# Altium schematic sheet VDUT.SchDoc
size Letter; SheetNumber: 6; SheetTotal: 15
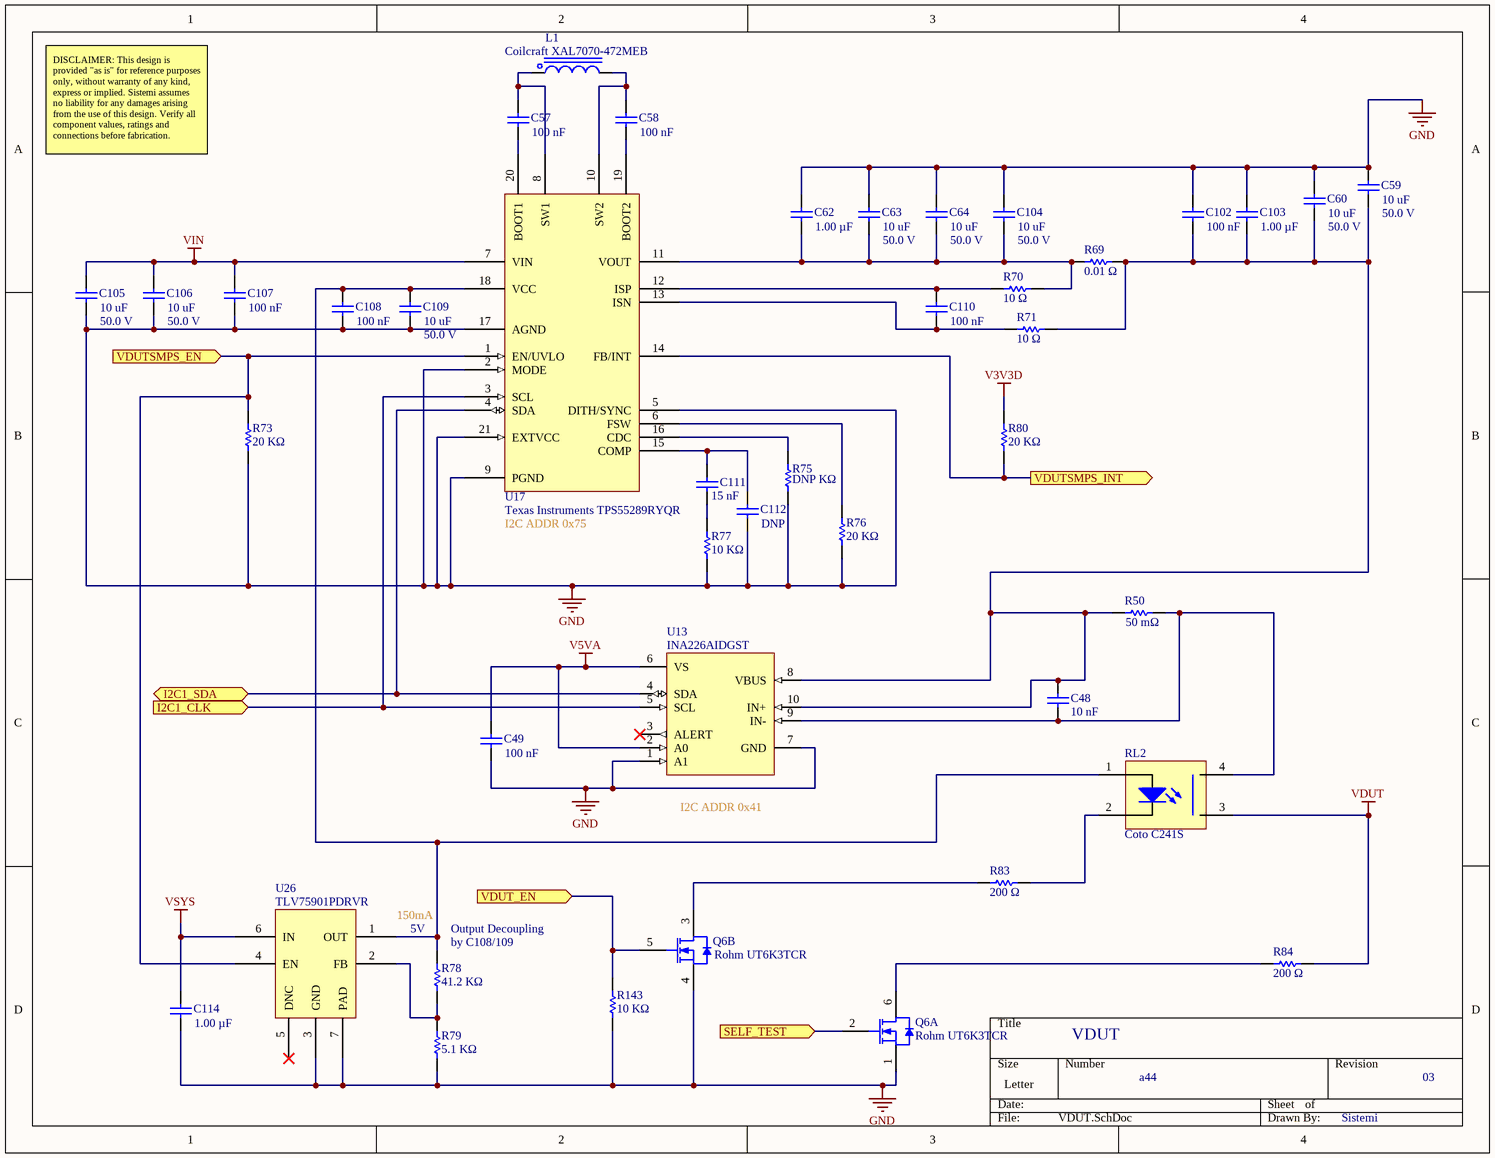
[diagram p0: VDUT.SchDoc]

## Parts
C48  Capacitance: 10 nF  [CAPC1005X56X25NL10T15]  (hidden comment: 10 nF,±10%,25V,CGO,0402)
C49  Capacitance: 100 nF  [CAPC1005X56X25NL10T15]  (hidden comment: Samsung CL05B104KO5NNNC)
C57  Capacitance: 100 nF  [CAPC1005X56X25NL10T15]  (hidden comment: Samsung CL05B104KO5NNNC)
C58  Capacitance: 100 nF  [CAPC1005X56X25NL10T15]  (hidden comment: Samsung CL05B104KO5NNNC)
C59  Capacitance: 10 uF  Voltage Rating (DC): 50.0 V  [CAPC3216X180X55LL20T25]  (hidden comment: Murata GRM31CR61H106KA12L)
C60  Capacitance: 10 uF  Voltage Rating (DC): 50.0 V  [CAPC3216X180X55LL20T25]  (hidden comment: Murata GRM31CR61H106KA12L)
C62  Capacitance: 1.00 µF  [CAPC1608X90X35NL15T15]  (hidden comment: Samsung CL10B105KA8NNNC)
C63  Capacitance: 10 uF  Voltage Rating (DC): 50.0 V  [CAPC3216X180X55LL20T25]  (hidden comment: Murata GRM31CR61H106KA12L)
C64  Capacitance: 10 uF  Voltage Rating (DC): 50.0 V  [CAPC3216X180X55LL20T25]  (hidden comment: Murata GRM31CR61H106KA12L)
C102  Capacitance: 100 nF  [CAPC1005X56X25NL10T15]  (hidden comment: Samsung CL05B104KO5NNNC)
C103  Capacitance: 1.00 µF  [CAPC1608X90X35NL15T15]  (hidden comment: Samsung CL10B105KA8NNNC)
C104  Capacitance: 10 uF  Voltage Rating (DC): 50.0 V  [CAPC3216X180X55LL20T25]  (hidden comment: Murata GRM31CR61H106KA12L)
C105  Capacitance: 10 uF  Voltage Rating (DC): 50.0 V  [CAPC3216X180X55LL20T25]  (hidden comment: Murata GRM31CR61H106KA12L)
C106  Capacitance: 10 uF  Voltage Rating (DC): 50.0 V  [CAPC3216X180X55LL20T25]  (hidden comment: Murata GRM31CR61H106KA12L)
C107  Capacitance: 100 nF  [CAPC1005X56X25NL10T15]  (hidden comment: Samsung CL05B104KO5NNNC)
C108  Capacitance: 100 nF  [CAPC1005X56X25NL10T15]  (hidden comment: Samsung CL05B104KO5NNNC)
C109  Capacitance: 10 uF  Voltage Rating (DC): 50.0 V  [CAPC3216X180X55LL20T25]  (hidden comment: Murata GRM31CR61H106KA12L)
C110  Capacitance: 100 nF  [CAPC1005X56X25NL10T15]  (hidden comment: Samsung CL05B104KO5NNNC)
C111  Capacitance: 15 nF  [CAPC1005X56X25NL10T15]  (hidden comment: 15 nF,±10%,25V,CGO,0402)
C112  Capacitance: DNP  [CAPC1005X56X25NL10T15]  (hidden comment: DNP,±10%,25V,CGO,0402)
C114  Capacitance: 1.00 µF  [CAPC1608X90X35NL15T15]  (hidden comment: Samsung CL10B105KA8NNNC)
L1  Coilcraft XAL7070-472MEB  [PCB-mw0ri1kelkujqd8k45jk-1]
Q6  Rohm UT6K3TCR  [DFN2020-8D]  (parts A,B of 2)
R50  Resistance: 50 mΩ  [RESC1608X55X30ML15T15]  (hidden comment: Generic RES 0603)
R69  Resistance: 0.01 Ω  [RESC1005X40X25NL05T05]  (hidden comment: 0.01 Ω,±1%,0402)
R70  Resistance: 10 Ω  [RESC1005X40X25NL05T05]  (hidden comment: 10 Ω,±1%,0402)
R71  Resistance: 10 Ω  [RESC1005X40X25NL05T05]  (hidden comment: 10 Ω,±1%,0402)
R73  Resistance: 20 KΩ  [RESC1608X55X30ML15T15]  (hidden comment: Generic RES 0603)
R75  Resistance: DNP KΩ  [RESC1005X40X25NL05T05]  (hidden comment: DNP KΩ,±1%,0402)
R76  Resistance: 20 KΩ  [RESC1608X55X30ML15T15]  (hidden comment: Generic RES 0603)
R77  Resistance: 10 KΩ  [RESC1608X55X30ML15T15]  (hidden comment: Generic RES 0603)
R78  Resistance: 41.2 KΩ  [RESC1608X55X30LL15T15]  (hidden comment: Generic RES 0603)
R79  Resistance: 5.1 KΩ  [RESC1608X55X30LL15T15]  (hidden comment: Generic RES 0603)
R80  Resistance: 20 KΩ  [RESC1608X55X30ML15T15]  (hidden comment: Generic RES 0603)
R83  Resistance: 200 Ω  [RESC1608X55X30LL15T15]  (hidden comment: Generic RES 0603)
R84  Resistance: 200 Ω  [RESC1608X55X30LL15T15]  (hidden comment: Generic RES 0603)
R143  Resistance: 10 KΩ  [RESC1608X55X30LL15T15]  (hidden comment: Generic RES 0603)
RL2  Coto C241S  [PCB-o1m8470la7x8r6xoffbd-1]
U13  INA226AIDGST  [TSSOP10]
U17  Texas Instruments TPS55289RYQR  [DSG8-1600X900TP]
U26  TLV75901PDRVR  [PCB-ude52gq66msu1251nhm5-1]

## Ports
I2C1_CLK (in), I2C1_SDA (bidir), SELF_TEST (in), VDUT_EN (in), VDUTSMPS_EN (in), VDUTSMPS_INT (out)

## Nets
3: Q6.8(D)
6: Q6.7(D)
GND: C49.1 C59.2 C60.2 C62.2 C63.2 C64.2 C102.2 C103.2 C104.2 C105.1 C106.1 C107.1 C108.1 C109.1 C112.1 C114.1 Q6.1(S) Q6.4(S) R73.1 R75.1 R76.1 R77.2 R79.1 R143.1 U13.1(A1) U13.7(GND) U17.2(MODE) U17.5(DITH/SYNC) U17.9(PGND) U17.17(AGND) U17.21(EXTVCC) U26.3(GND) U26.7(PAD)
V3V3D: R80.2
V5VA: C49.2 U13.2(A0) U13.6(VS)
VDUT: R84.1 RL2.3(S)
VIN: C105.2 C106.2 C107.2 U17.7(VIN)
VSYS: C114.2 U26.6(IN)
I2C1_CLK: U13.5(SCL) U17.3(SCL) ; port I2C1_CLK
I2C1_SDA: U13.4(SDA) U17.4(SDA) ; port I2C1_SDA
SELF_TEST: Q6.2(G) ; port SELF_TEST
VDUT_EN: Q6.5(G) R143.2 ; port VDUT_EN
VDUTSMPS_EN: R73.2 U17.1(EN/UVLO) U26.4(EN) ; port VDUTSMPS_EN
VDUTSMPS_INT: R80.1 U17.14(FB/INT) ; port VDUTSMPS_INT
NetC48_1: C48.1 R50.2 RL2.4(D) U13.9(IN-)
NetC48_2: C48.2 C59.1 C60.1 C102.1 C103.1 R50.1 R69.1 R71.1 U13.8(VBUS) U13.10(IN+)
NetC57_1: C57.1 U17.20(BOOT1)
NetC57_2: C57.2 L1.2 U17.8(SW1)
NetC58_1: C58.1 U17.19(BOOT2)
NetC58_2: C58.2 L1.1 U17.10(SW2)
NetC62_1: C62.1 C63.1 C64.1 C104.1 R69.2 R70.1 U17.11(VOUT)
NetC108_2: C108.2 C109.2 R78.2 RL2.1(A) U17.18(VCC) U26.1(OUT)
NetC110_1: C110.1 R71.2 U17.13(ISN)
NetC110_2: C110.2 R70.2 U17.12(ISP)
NetC111_1: C111.1 R77.1
NetC111_2: C111.2 C112.2 U17.15(COMP)
NetQ6_3: Q6.3(D) R83.2
NetQ6_6: Q6.6(D) R84.2
NetR75_2: R75.2 U17.16(CDC)
NetR76_2: R76.2 U17.6(FSW)
NetR78_1: R78.1 R79.2 U26.2(FB)
NetR83_1: R83.1 RL2.2(K)

Not connected (* = marked no-connect by the designer): U13 3(ALERT)*; U26 5(DNC)*

## Notes on the sheet
- DISCLAIMER: This design is provided "as is" for reference purposes only, without warranty of any kind, express or implied. Sistemi assumes no liability for any damages arising from the use of this design. Verify all component values, ratings and connections before fabrication.
- (near U17) I2C ADDR 0x75
- (near U13) I2C ADDR 0x41
- 150mA
- (near R78) 5V
- (near R78) Output Decoupling
- (near R78) by C108/109
- VDUT
- a44
- 03
- Sistemi

## Library data of the parts
C48 = CMP-bf2276a55d9a60e5-20: Generic CAP 0402, =Capacitance+','+Tolerance+','+Voltage+','+Dielectric+','+Case; Manufacturer Part Number: GRM1555C1E103JE01J; Lead-Free Status: Lead Free; Octopart URL: TBD; Case: 0402; OctopartID: 0755ced2c795d892; Voltage: 25V; Dielectric: CGO; RoHS: Compliant; Mounting Style: Surface Mount; Tolerance: ±10%; Footprint: PCB-0002-00476-3
C49 C57 C58 C102 C107 C108 C110 = CMP-bf2276a55d9a60e5-19: Ceramic capacitor SMD-0402 100nF /16V X7R# K +-10%, Samsung, RoHS; Dielectric Characteristic: X7R; Lead-Free Status: Lead Free; Voltage Rating (DC): 16.0 V; Capacitance Tolerance: ±10%; Mounting Style: Surface Mount; Case/Package: 0402; OctopartID: 0755ced2c795d892; Footprint: PCB-0002-00476-3; Octopart URL: https://octopart.com/cl05b104ko5nnnc-samsung-9299366; RoHS: Compliant; Manufacturer Part Number: CL05B104KO5NNNC
C59 C60 C63 C64 C104-C106 C109 = CMP-3554908-2: Multilayer Ceramic Capacitors MLCC - SMD/SMT 1206 10uF 50volt X5R +/-10%; Manufacturer Part Number: CL31B106KBHNNNE; Capacitance Tolerance: ±10%; Case/Package (SI): 3216; Lead-Free Status: Lead Free; Dielectric Characteristic: X5R; Lifecycle Status: Active; Mounting Style: Surface Mount; Number of Pins: 2; Octopart Url: https://octopart.com/grm31cr61h106ka12l-murata-18903335; OctopartID: fd8535afa9c42242; Packaging: Cut Tape (CT); REACH SVHC Compliance: No SVHC; RoHS: Compliant; Size-Length: 0.0032 m; Size-Thickness: 0.0016 m; Size-Width: 0.0016 m
C62 C103 C114 = CMP-7473528-5: CL Series 0603 1 uF 25 V ±10 % X7R Surface Mount Multilayer Ceramic Capacitor; Manufacturer Part Number: UMK107AB7105KA-T; Lead-Free Status: Lead Free; Capacitance Tolerance: ±10%; Voltage Rating (DC): 25.0 V; RoHS: Compliant; Mounting Style: Surface Mount; Footprint: PCB-0002-00062-3; Octopart URL: http://octopart.com/cl10b105ka8nnnc-samsung-19831597; Case/Package: 0603; OctopartID: ce7a065e703111bd; Dielectric Characteristic: X7R
C111 = CMP-bf2276a55d9a60e5-20: Generic CAP 0402, =Capacitance+','+Tolerance+','+Voltage+','+Dielectric+','+Case; Manufacturer Part Number: CGA2B3X7R1H153K050BB; Lead-Free Status: Lead Free; Octopart URL: TBD; Case: 0402; OctopartID: 0755ced2c795d892; Voltage: 25V; Dielectric: CGO; RoHS: Compliant; Mounting Style: Surface Mount; Tolerance: ±10%; Footprint: PCB-0002-00476-3
C112 = CMP-bf2276a55d9a60e5-20: Generic CAP 0402, =Capacitance+','+Tolerance+','+Voltage+','+Dielectric+','+Case; Manufacturer Part Number: TBD; Lead-Free Status: Lead Free; Octopart URL: TBD; Case: 0402; OctopartID: 0755ced2c795d892; Voltage: 25V; Dielectric: CGO; RoHS: Compliant; Mounting Style: Surface Mount; Tolerance: ±10%; Footprint: PCB-0002-00476-3
L1 = CMP-70ddb8c9bb54af1a-1: Power inductor, shielded, 20% tol, SMT, RoHS, halogen f; Lead-Free Status: Contains Lead; Manufacturer Part Number: XAL7070-472MEB; Mounting Style: Surface Mount; Lifecycle Status: Active; Octopart Url: https://octopart.com/xal7070-472meb-coilcraft-18804463; RoHS: Compliant; OctopartID: 70ddb8c9bb54af1a; Packaging: Reel
Q6 = CMP-7da2b0d499b7a265-2: On a Reel of 3000, Dual N-Channel MOSFET, 5.5 A, 30 V, 8-Pin DFN ROHM UT6K3TCR; Polarity: Dual N-Channel; Footprint: PCB-qj1nrqbgj5udp5r3frdj-1; RoHS: Compliant; OctopartID: 7da2b0d499b7a265; Manufacturer Part Number: UT6K3TCR; Operating Temperature: 150 °C (max); Octopart URL: https://octopart.com/ut6k3tcr-rohm-75284851
R50 = CMP-0800c38b3cf2d7c7-3: Generic RES 0603, =Resistance+','+Tolerance+','+Case; Manufacturer Part Number: WSLP0603R0500FEB; Case/Package (SI): 1608; Lead-Free Status: Lead Free; Power Rating: 63.0 mW; Voltage: 50V; ELV Compliant: Compliant; Tolerance: ±1%; Temperature Coefficient: -50.0 ppm/°C to 50.0 ppm/°C; Octopart URL: TBD; Number of Pins: 2; Mounting Style: Surface Mount; Packaging: Tape & Reel (TR); Lifecycle Status: Active; RoHS: Compliant; Case: 0603; Operating Temperature: -55.0 °C to 125 °C; REACH SVHC Compliance: No SVHC; Footprint: PCB-0002-00066-3; OctopartID: a8e96364fc37772e
R69 = CMP-3902036-3: Generic RES 0402, =Resistance+','+Tolerance+','+Case; Manufacturer Part Number: MFSA0402R0100FAM; Lead-Free Status: Lead Free; Voltage: 50.0 V; Power: 0.063 W; Mounting Style: Surface Mount; RoHS: Compliant; Number of Pins: 2; Tolerance: ±1%; Octopart Url: TBD; Case: 0402; OctopartID: 26dced8948c2f91b
R70 R71 = CMP-3902036-3: Generic RES 0402, =Resistance+','+Tolerance+','+Case; Manufacturer Part Number: RT0402FRE0710RL; Lead-Free Status: Lead Free; Voltage: 50.0 V; Power: 0.063 W; Mounting Style: Surface Mount; RoHS: Compliant; Number of Pins: 2; Tolerance: ±1%; Octopart Url: TBD; Case: 0402; OctopartID: 26dced8948c2f91b
R73 R76 R80 = CMP-0800c38b3cf2d7c7-3: Generic RES 0603, =Resistance+','+Tolerance+','+Case; Manufacturer Part Number: RT0603FRE1320KL; Case/Package (SI): 1608; Lead-Free Status: Lead Free; Power Rating: 63.0 mW; Voltage: 50V; ELV Compliant: Compliant; Tolerance: ±1%; Temperature Coefficient: -50.0 ppm/°C to 50.0 ppm/°C; Octopart URL: TBD; Number of Pins: 2; Mounting Style: Surface Mount; Packaging: Tape & Reel (TR); Lifecycle Status: Active; RoHS: Compliant; Case: 0603; Operating Temperature: -55.0 °C to 125 °C; REACH SVHC Compliance: No SVHC; Footprint: PCB-0002-00066-3; OctopartID: a8e96364fc37772e
R75 = CMP-3902036-3: Generic RES 0402, =Resistance+','+Tolerance+','+Case; Manufacturer Part Number: TBD; Lead-Free Status: Lead Free; Voltage: 50.0 V; Power: 0.063 W; Mounting Style: Surface Mount; RoHS: Compliant; Number of Pins: 2; Tolerance: ±1%; Octopart Url: TBD; Case: 0402; OctopartID: 26dced8948c2f91b
R77 R143 = CMP-0800c38b3cf2d7c7-3: Generic RES 0603, =Resistance+','+Tolerance+','+Case; Manufacturer Part Number: MCT06030C1002FP500; Case/Package (SI): 1608; Lead-Free Status: Lead Free; Power Rating: 63.0 mW; Voltage: 50V; ELV Compliant: Compliant; Tolerance: ±1%; Temperature Coefficient: -50.0 ppm/°C to 50.0 ppm/°C; Octopart URL: TBD; Number of Pins: 2; Mounting Style: Surface Mount; Packaging: Tape & Reel (TR); Lifecycle Status: Active; RoHS: Compliant; Case: 0603; Operating Temperature: -55.0 °C to 125 °C; REACH SVHC Compliance: No SVHC; Footprint: PCB-0002-00066-3; OctopartID: a8e96364fc37772e
R78 = CMP-0800c38b3cf2d7c7-3: Generic RES 0603, =Resistance+','+Tolerance+','+Case; Manufacturer Part Number: RT0603BRE0741K2L; Case/Package (SI): 1608; Lead-Free Status: Lead Free; Power Rating: 63.0 mW; Voltage: 50V; ELV Compliant: Compliant; Tolerance: ±1%; Temperature Coefficient: -50.0 ppm/°C to 50.0 ppm/°C; Octopart URL: TBD; Number of Pins: 2; Mounting Style: Surface Mount; Packaging: Tape & Reel (TR); Lifecycle Status: Active; RoHS: Compliant; Case: 0603; Operating Temperature: -55.0 °C to 125 °C; REACH SVHC Compliance: No SVHC; Footprint: PCB-0002-00066-3; OctopartID: a8e96364fc37772e
R79 = CMP-0800c38b3cf2d7c7-3: Generic RES 0603, =Resistance+','+Tolerance+','+Case; Manufacturer Part Number: RT0603FRE075K1L; Case/Package (SI): 1608; Lead-Free Status: Lead Free; Power Rating: 63.0 mW; Voltage: 50V; ELV Compliant: Compliant; Tolerance: ±1%; Temperature Coefficient: -50.0 ppm/°C to 50.0 ppm/°C; Octopart URL: TBD; Number of Pins: 2; Mounting Style: Surface Mount; Packaging: Tape & Reel (TR); Lifecycle Status: Active; RoHS: Compliant; Case: 0603; Operating Temperature: -55.0 °C to 125 °C; REACH SVHC Compliance: No SVHC; Footprint: PCB-0002-00066-3; OctopartID: a8e96364fc37772e
R83 R84 = CMP-0800c38b3cf2d7c7-3: Generic RES 0603, =Resistance+','+Tolerance+','+Case; Manufacturer Part Number: RT0603FRE10200RL; Case/Package (SI): 1608; Lead-Free Status: Lead Free; Power Rating: 63.0 mW; Voltage: 50V; ELV Compliant: Compliant; Tolerance: ±1%; Temperature Coefficient: -50.0 ppm/°C to 50.0 ppm/°C; Octopart URL: TBD; Number of Pins: 2; Mounting Style: Surface Mount; Packaging: Tape & Reel (TR); Lifecycle Status: Active; RoHS: Compliant; Case: 0603; Operating Temperature: -55.0 °C to 125 °C; REACH SVHC Compliance: No SVHC; Footprint: PCB-0002-00066-3; OctopartID: a8e96364fc37772e
RL2 = CMP-147564696-2: Coto Mosfet - 1 Form A, 5A, 20V Max/ Tape-Reel; OctopartID: 147564696; Manufacturer Part Number: C241S; Octopart Url: https://octopart.com/c241s-coto-147564696
U13 = CMP-947c5c4360184bbb-17: 36-V, Bi-Directional, Ultra-High Accuracy, Low-/High-Side, I2C Out Current/Power Monitor w/ Alert 10-VSSOP -40 to 125; Manufacturer Part Number: INA226AIDGST
U17 = CMP-277ee9be38fdf8b9-1: 30-V 8-A buck-boost converter with I²C interface 21-VQFN-HR -40 to 125; Octopart Url: https://octopart.com/tps55289ryqr-texas+instruments-130693861; Manufacturer Part Number: TPS55289RYQR; Lifecycle Status: Not Listed by Manufacturer; OctopartID: 277ee9be38fdf8b9
U26 = CMP-2b7ce7b2db7ff4bb-4: LDO Regulator Pos 0.55V to 5.5V 1A 6-Pin WSON EP T/R; Dropout Voltage: 190 mV; Number of Regulated Outputs: 1; Output Capacitor Type: Ceramic; Quiescent Current: 25.0 µA; OctopartID: 2b7ce7b2db7ff4bb; Manufacturer Part Number: TLV75901PDRVR; Footprint: PCB-6kp9dl1mk9yrlugndkjx-1; RoHS: Compliant; Octopart URL: https://octopart.com/tlv75901pdrvr-texas+instruments-96785765; Number of Pins: 6; Lifecycle Status: Pre-Release; Case/Package: WSON; Operating Temperature: -40.0 °C to 125 °C